# Altium schematic sheet 02_MCU.SchDoc
size A4; SheetNumber: 3; SheetTotal: 6
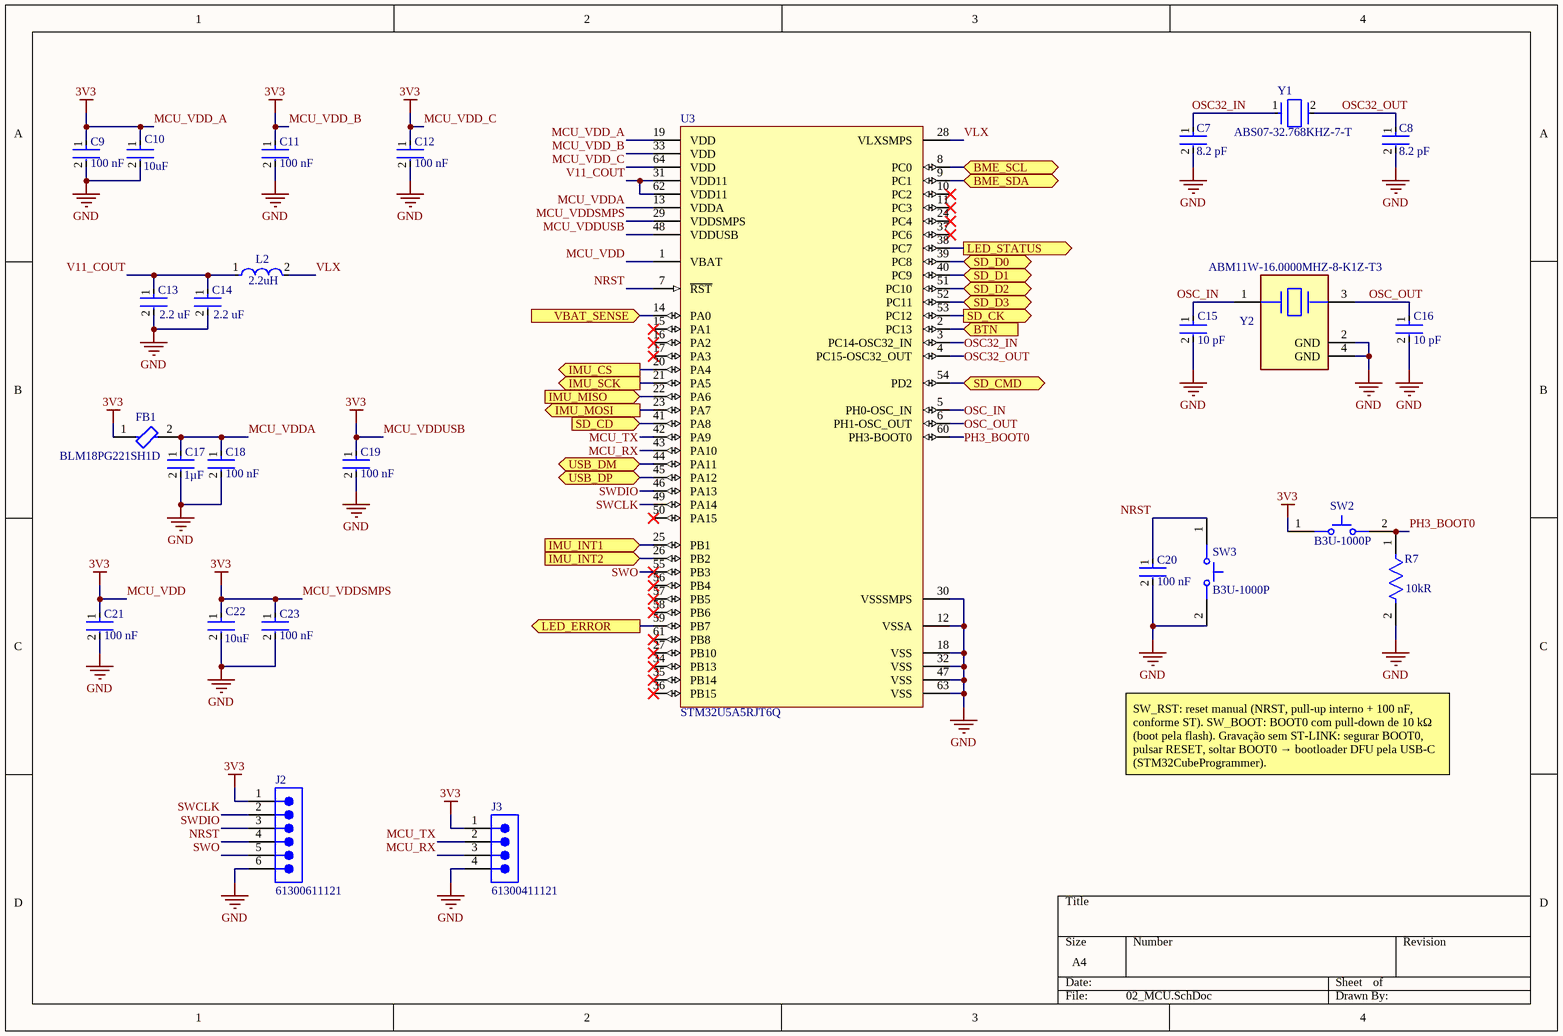
[diagram p0: 02_MCU.SchDoc]

## Parts
C7  value 8.2 pF  [FP-C0402-BB-MFG]  (hidden comment: C0402C829D5GACTU)
C8  value 8.2 pF  [FP-C0402-BB-MFG]  (hidden comment: C0402C829D5GACTU)
C9  Capacitance: 100 nF  [FP-CC0603-DA-MFG]  (hidden comment: CC0603KRX7R9BB104)
C10  value 10uF  [FP-GRM21B-0_2-e0_2_0_7-IPC_B]  (hidden comment: GRM21BZ71E106KE15K)
C11  Capacitance: 100 nF  [FP-CC0603-DA-MFG]  (hidden comment: CC0603KRX7R9BB104)
C12  Capacitance: 100 nF  [FP-CC0603-DA-MFG]  (hidden comment: CC0603KRX7R9BB104)
C13  value 2.2 uF  [FP-CC0603-DA-MFG]  (hidden comment: CC0603KRX7R7BB225)
C14  value 2.2 uF  [FP-CC0603-DA-MFG]  (hidden comment: CC0603KRX7R7BB225)
C15  value 10 pF  [FP-C0402-BB-MFG]  (hidden comment: C0402C100C5GACTU)
C16  value 10 pF  [FP-C0402-BB-MFG]  (hidden comment: C0402C100C5GACTU)
C17  Capacitance: 1µF  [FP-GCM188-0_1-MFG]  (hidden comment: GCM188R71E105KA64D)
C18  Capacitance: 100 nF  [FP-CC0603-DA-MFG]  (hidden comment: CC0603KRX7R9BB104)
C19  Capacitance: 100 nF  [FP-CC0603-DA-MFG]  (hidden comment: CC0603KRX7R9BB104)
C20  Capacitance: 100 nF  [FP-CC0603-DA-MFG]  (hidden comment: CC0603KRX7R9BB104)
C21  Capacitance: 100 nF  [FP-CC0603-DA-MFG]  (hidden comment: CC0603KRX7R9BB104)
C22  value 10uF  [FP-GRM21B-0_2-e0_2_0_7-IPC_B]  (hidden comment: GRM21BZ71E106KE15K)
C23  Capacitance: 100 nF  [FP-CC0603-DA-MFG]  (hidden comment: CC0603KRX7R9BB104)
FB1  BLM18PG221SH1D  [FP-BLM18-0_15-t0_8-IPC_C]
J2  61300611121  [61300611121]
J3  61300411121  [61300411121]
L2  Inductance: 2.2uH  [FP-LQM21PH_G0-IPC_C]  (hidden comment: LQM21PN2R2MGHL)
R7  Resistance: 10kR  [FP-RC0603-0_55-IPC_C]  (hidden comment: RC0603FR-0710KL)
SW2  B3U-1000P  [OMRON-B3U-1000_V]
SW3  B3U-1000P  [OMRON-B3U-1000_V]
U3  STM32U5A5RJT6Q  [LQFP64-5W_MFG]
Y1  ABS07-32.768KHZ-7-T  [FP-ABS07-MFG]
Y2  ABM11W-16.0000MHZ-8-K1Z-T3  [FP-ABM11W-MFG]

## Ports
BME_SCL (bidir, see 00_Top[2C], 03_Sensors[3C]), BME_SDA (bidir, see 00_Top[2C], 03_Sensors[3D]), BTN (in, see 00_Top[3C], 05_Interface[3B]), IMU_CS (out, see 00_Top[2B], 03_Sensors[2B]), IMU_INT1 (in, see 00_Top[2C], 03_Sensors[2B]), IMU_INT2 (in, see 00_Top[2C], 03_Sensors[2B]), IMU_MISO (in, see 00_Top[2B], 03_Sensors[3A]), IMU_MOSI (out, see 00_Top[2B], 03_Sensors[3B]), IMU_SCK (out, see 00_Top[2B], 03_Sensors[3B]), LED_ERROR (out, see 00_Top[3C], 05_Interface[1B]), LED_STATUS (out, see 00_Top[3B], 05_Interface[1C]), SD_CD (in, see 00_Top[3B], 04_microSD[3B]), SD_CK (out, see 00_Top[3B], 04_microSD[2B]), SD_CMD (bidir, see 00_Top[3B], 04_microSD[3B]), SD_D0 (bidir, see 00_Top[3A], 04_microSD[3B]), SD_D1 (bidir, see 00_Top[3B], 04_microSD[3B]), SD_D2 (bidir, see 00_Top[3B], 04_microSD[3B]), SD_D3 (bidir, see 00_Top[3B], 04_microSD[3B]), USB_DM (bidir, see 00_Top[2B], 01_Power[2C]), USB_DP (bidir, see 00_Top[2A], 01_Power[2D]), VBAT_SENSE (in, see 00_Top[2B], 01_Power[4B])

## Nets
GND: C7.2 C8.2 C9.2 C10.2 C11.2 C12.2 C13.2 C14.2 C15.2 C16.2 C17.2 C18.2 C19.2 C20.2 C21.2 C22.2 C23.2 J2.6 J3.4 R7.2 SW3.2 U3.12(VSSA) U3.18(VSS) U3.30(VSSSMPS) U3.32(VSS) U3.47(VSS) U3.63(VSS) Y2.2(GND) Y2.4(GND)
MCU_VDD: C9.1 C10.1 C11.1 C12.1 C19.1 C21.1 C22.1 C23.1 FB1.1 J2.1 J3.1 SW2.1 U3.1(VBAT) U3.19(VDD) U3.29(VDDSMPS) U3.33(VDD) U3.48(VDDUSB) U3.64(VDD)  [also labelled 3V3, MCU_VDD_A, MCU_VDD_B, MCU_VDD_C, MCU_VDDSMPS, MCU_VDDUSB]
BME_SCL: U3.8(PC0) ; port BME_SCL
BME_SDA: U3.9(PC1) ; port BME_SDA
BTN: U3.2(PC13) ; port BTN
IMU_CS: U3.20(PA4) ; port IMU_CS
IMU_INT1: U3.25(PB1) ; port IMU_INT1
IMU_INT2: U3.26(PB2) ; port IMU_INT2
IMU_MISO: U3.22(PA6) ; port IMU_MISO
IMU_MOSI: U3.23(PA7) ; port IMU_MOSI
IMU_SCK: U3.21(PA5) ; port IMU_SCK
LED_ERROR: U3.59(PB7) ; port LED_ERROR
LED_STATUS: U3.38(PC7) ; port LED_STATUS
MCU_RX: J3.3 U3.43(PA10)
MCU_TX: J3.2 U3.42(PA9)
MCU_VDDA: C17.1 C18.1 FB1.2 U3.13(VDDA)
NRST: C20.1 J2.4 SW3.1 U3.7(~{RST})
OSC32_IN: C7.1 U3.3(PC14-OSC32_IN) Y1.1
OSC32_OUT: C8.1 U3.4(PC15-OSC32_OUT) Y1.2
OSC_IN: C15.1 U3.5(PH0-OSC_IN) Y2.1
OSC_OUT: C16.1 U3.6(PH1-OSC_OUT) Y2.3
PH3_BOOT0: R7.1 SW2.2 U3.60(PH3-BOOT0)
SD_CD: U3.41(PA8) ; port SD_CD
SD_CK: U3.53(PC12) ; port SD_CK
SD_CMD: U3.54(PD2) ; port SD_CMD
SD_D0: U3.39(PC8) ; port SD_D0
SD_D1: U3.40(PC9) ; port SD_D1
SD_D2: U3.51(PC10) ; port SD_D2
SD_D3: U3.52(PC11) ; port SD_D3
SWCLK: J2.2 U3.49(PA14)
SWDIO: J2.3 U3.46(PA13)
SWO: J2.5 U3.55(PB3)
USB_DM: U3.44(PA11) ; port USB_DM
USB_DP: U3.45(PA12) ; port USB_DP
V11_COUT: C13.1 C14.1 L2.1 U3.31(VDD11) U3.62(VDD11)
VBAT_SENSE: U3.14(PA0) ; port VBAT_SENSE
VLX: L2.2 U3.28(VLXSMPS)

Not connected (* = marked no-connect by the designer): U3 10(PC2)* 11(PC3)* 15(PA1)* 16(PA2)* 17(PA3)* 24(PC4)* 27(PB10)* 34(PB13)* 35(PB14)* 36(PB15)* 37(PC6)* 50(PA15)* 56(PB4)* 57(PB5)* 58(PB6)* 61(PB8)*

## Notes on the sheet
- SW_RST: reset manual (NRST, pull-up interno + 100 nF, conforme ST). SW_BOOT: BOOT0 com pull-down de 10 kΩ (boot pela flash). Gravação sem ST-LINK: segurar BOOT0, pulsar RESET, soltar BOOT0 → bootloader DFU pela USB-C (STM32CubeProgrammer).

## Library data of the parts
C7 C8 = CMP-1034-00609-3: CAP CER 8.2PF 50V C0G/NP0 0402; Manufacturer: Kemet; Temperature Characteristic: C0G; Tolerance: 0.5 pF; Material: Ceramic; Temperature Coefficient: 15%; Voltage Rating: 50 V; Digikey Description: CAP CER 8.2PF 50V C0G/NP0 0402; Category: Cap; Automotive: No; Ipc Land Pattern Name: CAPC10050X50; Device Class L2: Capacitors; Temperature: -55°C to +125°C; ComponentLink2URL: https://content.kemet.com/datasheets/KEM_C1002_X7R_SMD.pdf; Height: 0.55mm; Device Class L1: Passive Components; Mouser Description: Multilayer Ceramic Capacitors MLCC - SMD/SMT 50volts 8.2pF C0G 0.5%; RoHS: TRUE; Temperature Range High: +125°C; Manufacturer Part Number: C0402C829D5GACTU; Package: C0402-BB; Temperature Range Low: -55°C; ComponentLink2Description: Datasheet; Octopart: https://octopart.com/c0402c829d5gactu-kemet-193081; Device Class L3: Ceramic Capacitors; Capacitance: 8.2 pF; Lead Free: Yes
C9 C11 C12 C18-C21 C23 = CMP-2100-03601-2: CAP CER 0.1UF 50V X7R 0603; Manufacturer: YAGEO; Material: Ceramic; Temperature Coefficient: 15%; Tolerance: 0.1; Value: 100 nF; Height: 0.9mm; Voltage: 50 V; ComponentLink2Description: Datasheet; Device Class L2: Capacitors; Temperature Range High: +125°C; Category: Cap; Footprint Url: http://www.yageo.com/exep/pages/download/literatures/UPY-C_GEN_24.pdf; ComponentLink2URL: http://www.yageo.com/documents/recent/UPY-GPHC_X7R_6.3V-to-50V_18.pdf; Package: CC0603-DA; Temperature: -55°C to +125°C; Voltage Rating: 50 V; Temperature Characteristic: X7R; Device Class L1: Passive Components; Temperature Range Low: -55°C; Manufacturer Part Number: CC0603KRX7R9BB104; RoHS: TRUE; Automotive: No; Device Class L3: Ceramic Capacitors; Octopart: https://octopart.com/cc0603krx7r9bb104-yageo-42244635; Mouser Description: Multilayer Ceramic Capacitor, CC Series, 0.1 - F, - 10%, X7R, 50 V, 0603 [1608 Metric]; Lead Free: Yes; Digikey Description: CAP CER 0.1UF 50V X7R 0603
C10 C22 = CMP-06035-042430-1: Chip Multilayer Ceramic Capacitors for General Purpose, 0805, 10uF, X7R, 15%, 10%, 25V; Case/Package: 0805
C13 C14 = CMP-03422-001238-1: CAP CER 2.2UF 16V X7R 0603; Manufacturer: YAGEO; Temperature Coefficient: 15%; Material: Ceramic; Tolerance: 0.1; Voltage: 16 V; Temperature Range High: +125°C; Digikey Description: CAP CER 2.2UF 16V X7R 0603; Temperature: -55°C to +125°C; Lead Free: Yes; Capacitance: 2.2 uF; Package: CC0603-DA; ComponentLink2URL: http://www.yageo.com/documents/recent/UPY-GPHC_X7R_6.3V-to-50V_18.pdf; Device Class L1: Passive Components; Category: Cap; Manufacturer Part Number: CC0603KRX7R7BB225; ComponentLink2Description: Datasheet; Mouser Description: Cap Ceramic 2.2uF 16V X7R 10% Pad SMD 0603 125C Automotive T/R; Device Class L2: Capacitors; RoHS: TRUE; Automotive: No; Voltage Rating: 16 V; Device Class L3: Ceramic Capacitors; Temperature Range Low: -55°C; Height: 0.9mm; Footprint Url: http://www.yageo.com/exep/pages/download/literatures/UPY-C_GEN_24.pdf; Temperature Characteristic: X7R; Octopart: https://octopart.com/cc0603krx7r7bb225-yageo-67146440
C15 C16 = CMP-2008-03045-2: CAP CER 10PF 50V NP0 0402; Manufacturer: Kemet; Material: Ceramic; Temperature Coefficient: 15%; Temperature Characteristic: C0G; Tolerance: 0.25 pF; Category: Cap; Ipc Land Pattern Name: CAPC10050X50; Voltage Rating: 50 V; Automotive: No; Temperature Range High: +125°C; ComponentLink2URL: https://content.kemet.com/datasheets/KEM_C1002_X7R_SMD.pdf; Package: C0402-BB; Capacitance: 10 pF; Temperature: -55°C to +125°C; Height: 0.55mm; Lead Free: Yes; RoHS: TRUE; Mouser Description: Multilayer Ceramic Capacitors MLCC - SMD/SMT 50volts 10pF C0G C0G +/-0.25pF; Octopart: https://octopart.com/c0402c100c5gactu-kemet-125456; Digikey Description: CAP CER 10PF 50V NP0 0402; Device Class L1: Passive Components; Manufacturer Part Number: C0402C100C5GACTU; Device Class L2: Capacitors; Temperature Range Low: -55°C; ComponentLink2Description: Datasheet; Device Class L3: Ceramic Capacitors
C17 = CMP-2006-02363-4: Manufacturer Lifecycle Status: IN PRODUCTION; NexarPartId: 18909256; Dielectric: X7R; Material: Ceramic; Tolerance: 10%; Voltage Rating: 25V; Thickness: 889µm; Max Operating Temperature: 125°C; Radiation Hardening: No; Weight: 6.293594mg; Lead Free: Lead Free; Mount: Surface Mount; Case Code (Imperial): 0603; REACH SVHC: No SVHC; Lifecycle Status: Production; Depth: 800µm; Min Operating Temperature: -55°C; Height: 800µm; Case Code (Metric): 1608; Case/Package: 0603; Voltage: 25V; Packaging: Cut Tape; Length: 1.6mm; Termination: SMD/SMT; Width: 787.4µm; Voltage Rating (DC): 25V; RoHS: Compliant; Schedule B: 8532240020, 8532240020; Ratings: AEC-Q200
FB1 = CMP-06046-000201-1: Chip Ferrite Bead, 0603, 220Ω @ 100MHz, 0.1Ω, 25%, 1.4A; DC Resistance (DCR): 100mR; Impedance: 220R; Number of Lines: 1; Core Material: Ferrite; Mount: Surface Mount; Lead Free: Lead Free; Package Quantity: 4000; Case Code (Imperial): 0603; Current Rating: 1.4A; Height: 0.037inch; Length: 0.063inch; Ratings: AEC-Q200; Max Current Rating: 1.4A; Width: 0.8mm; Tolerance: 25%; Min Operating Temperature: -55°C; Number of Circuits: 1; Termination: SMD/SMT; Max Operating Temperature: 125°C; REACH SVHC: No SVHC; Case Code (Metric): 1608; Depth: 0.95mm; Case/Package: 0603; Packaging: Tape and Reel; Max DC Current: 1.4A; Test Frequency: 100MHz
J2 = CMP-1502-01070-4: THT Vertical Pin Header WR-PHD, Pitch 2.54 mm, Single Row, 6 pins; Pitch: 2.54mm; Operating Supply Voltage: 250V; Connector Type: Male Pin; Gender: Male; Number of Positions: 6; Contact Resistance: 20mΩ; Current Rating: 3A; Termination: Through Hole; Color: Black; Number of Pins: 6; Lead Pitch: 2.54mm; Height: 8.89mm; RoHS: Compliant; Lead Free: Lead Free; Contact Mating Length: 5.9944mm; Contact Plating: Gold; Contact Gender: Male; Packaging: Bulk; Orientation: Vertical; Mount: Through Hole; Voltage Rating: 250V; Number of Rows: 1; Max Operating Temperature: 105°C; Min Operating Temperature: -40°C; Housing Material: PBT; Contact Material: Gold; Number of Contacts: 6
J3 = CMP-1502-01064-4: THT Vertical Pin Header WR-PHD, Pitch 2.54 mm, Single Row, 4 pins; Connector Type: Male Pin; Gender: Male; Current Rating: 3A; Number of Positions: 4; Operating Supply Voltage: 250V; Contact Resistance: 20mΩ; Pitch: 2.54mm; Max Operating Temperature: 105°C; Mount: Through Hole; Contact Material: Gold; Contact Plating: Gold; Number of Contacts: 4; Orientation: Vertical; Packaging: Bulk; Contact Mating Length: 5.9944mm; Voltage Rating: 250V; Number of Rows: 1; Height: 8.89mm; Lead Free: Lead Free; Lead Pitch: 2.54mm; Number of Pins: 4; Color: Black; Min Operating Temperature: -40°C; RoHS: Compliant; Termination: Solder
L2 = CMP-06042-014073-1: Multilayer Type Inductor for Power Lines, 0805 (2012), 2.2μH, 20%, 0.156Ω, 1.7A; Self Resonant Frequency: 40MHz; DC Resistance (DCR): 156mR; Test Frequency: 1MHz; Saturation Current: 450mA; Core Material: Ferrite; Shielding: Shielded; Current Rating: 1.3A; Termination: SMD/SMT; Min Operating Temperature: -40°C; Case Code (Metric): 2012; Mount: Surface Mount; Length: 0.079inch; Package Quantity: 3000; Width: 0.049inch; Max Operating Temperature: 85°C; Weight: 0.000194oz; Height - Seated (Max): 0.039inch; Height: 0.9mm; Tolerance: 20%; Max DC Current: 1.3A; Packaging: Tape and Reel; Case/Package: 0805; Case Code (Imperial): 0805
R7 = CMP-2100-03664-2: RES 10K OHM 1% 1/10W 0603; Voltage Rating: 75V; Voltage Rating (DC): 50V; Power Rating: 100mW; Temperature Coefficient: 100ppm/°C; Depth: 0.8mm; Termination: SMD/SMT; Resistor Type: Thick Film; Series: RC; Construction: Rectangular; Features: Moisture Resistant; Packaging: Tape and Reel; Min Operating Temperature: -55°C; Number of Terminations: 2; Lead Pitch: 0.3mm; RoHS Compliant: Yes; Case/Package: 0603; Resistance Tolerance: 1%; Military Standard: Not; Weight: 7.1E-05oz; Number of Pins: 2; Tolerance: 1%; Length: 1.6mm; Case Code (Imperial): 0603; Lead Free: Lead Free; Width: 0.8mm; Max Power Dissipation: 100mW; Height: 0.45mm; Max Operating Temperature: 155°C; Case Code (Metric): 1608; Size Code: 0603
SW2 SW3 = CMP-011-00000-2: Tactile Switch, SPST-NO, 0.05 A, 12 V, -25 to 70 degC, 2-Pin SMD, RoHS, Tape and Reel; Manufacturer: Omron Electronic Components; IP Rating: IP40; Current Rating: 50mA; Max Contact Resistance: 100mohm; Operating Force: 153gf; Throw Configuration: SPST; Resistance: 0.1Ohm; Max Voltage Rating (DC): 12V; Contact Material: Silver; Max Current Rating: 50mA; Datasheet URL: http://www.omron.com/ecb/products/pdf/en-b3u.pdf; Mounting Technology: SM; Case/Package: B3U-1000; Packaging: TapeandReel; Package Reference: B3U-1000; Manufacturer URL: http://www.omron.com/; Datasheet Version: Jan-15; RoHS Compliant: True; Max Operating Temperature: 70°C; Contact Current Rating: 50mA; Package Quantity: 3500; Package Description: 2-Pin Surface Mount Device, Body 3 x 2.5 mm; Voltage Rating (DC): 12V; Min Operating Temperature: -25°C; Voltage Rating: 12V
U3 = CMP-00355-135308217-1: ARM Microcontrollers - MCU Ultra-low-power FPU Arm Cortex-M33 MCU TrustZone, 160; ComponentLink2Description: Datasheet URL; ComponentLink1Description: Manufacturer's Website; HelpURL: https://www.st.com/resource/en/datasheet/stm32u5a5aj.pdf; Lifecycle Status: Production; ComponentLink1URL: http://www.st.com; ComponentLink2URL: https://www.st.com/resource/en/datasheet/stm32u5a5aj.pdf
Y1 = CMP-27762-014373-1: Crystal 32.768kHz ±20ppm (Tol) 7pF FUND 70kΩ 2-Pin CSMD T/R; Insulation Resistance: 500MR; Series Resistance: 70kR; Mount: Surface Mount; Tolerance: 20ppm; Length: 3.2mm; Lead Free: Lead Free; Frequency: 32.768kHz; Frequency Tolerance: 20ppm; Frequency Stability: 20ppm; Load Capacitance: 7pF; Radiation Hardening: No; Package Quantity: 3000; Width: 1.5mm; Height: 0.9mm; Termination: SMD/SMT; Max Operating Temperature: 85°C; Number of Pins: 2; Operating Frequency: 32.768 kHz; ESR (Equivalent Series Resistance): 70kR; Packaging: Tape and Reel; Series: ABS07; Min Operating Temperature: -40°C; Depth: 1.5mm; Case/Package: CSMD
Y2 = CMP-27762-006513-1: Crystal 16MHz ±10ppm 8pF SMD-4 2mm x 1.6mm; RoHS Compliant: Yes